# Altium schematic sheet PowerStage.SchDoc
size A4; CompanyName: HEPL; Engineer: CBR; Address1: Quai Gloesener 6; Address2: 4020, liege; SheetNumber: 4; SheetTotal: 5; Version: 1.0
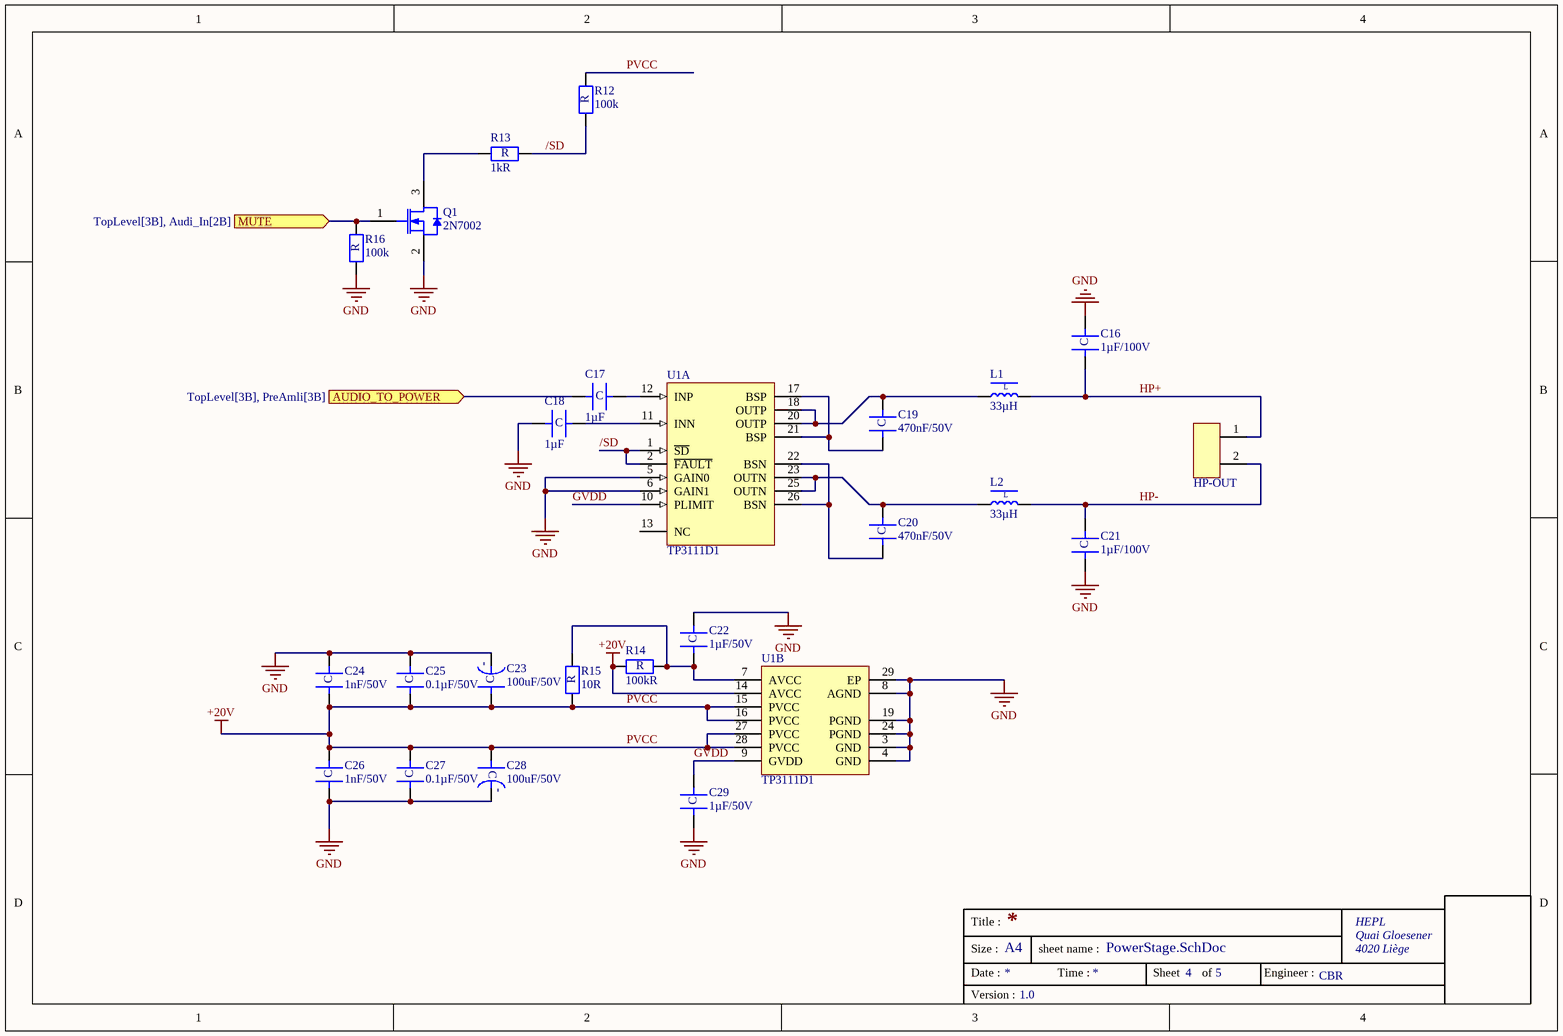
[diagram p0: PowerStage.SchDoc]

## Parts
C16  1µF/100V  [C180x75]
C17  1µF  [1206-C]
C18  1µF  [1206-C]
C19  470nF/50V  [1206-C]
C20  470nF/50V  [1206-C]
C21  1µF/100V  [C180x75]
C22  1µF/50V  [1206-C]
C23  100uF/50V  [C100x160]
C24  1nF/50V  [1206-C]
C25  0.1µF/50V  [1206-C]
C26  1nF/50V  [1206-C]
C27  0.1µF/50V  [1206-C]
C28  100uF/50V  [C100x160]
C29  1µF/50V  [1206-C]
HP-OUT  (no value)  [TS-75x70]
L1  33µH  [SRR1260]
L2  33µH  [SRR1260]
Q1  2N7002  [INF-PG-SOT23_M]
R12  100k  [1206-R]
R13  1kR  [1206-R]
R14  100kR  [1206-R]
R15  10R  [1206-R]
R16  100k  [1206-R]
U1  TP3111D1  [TI-PWP28-5720X1950TP_M]  (parts A,B of 2)

## Ports
AUDIO_TO_POWER (in, see TopLevel[3B], PreAmli[3B]), MUTE (in, see TopLevel[3B], Audi_In[2B])

## Nets
GND: C16.2 C18.1 C21.1 C22.2 C23.2 C24.2 C25.2 C26.1 C27.1 C28.2 C29.1 Q1.2(SOURCE) R16.1 U1.3(GND) U1.4(GND) U1.5(GAIN0) U1.6(GAIN1) U1.8(AGND) U1.19(PGND) U1.24(PGND) U1.29(EP)
PVCC: C23.1 C24.1 C25.1 C26.2 C27.2 C28.1 R12.2 R14.1 R15.1 U1.14(AVCC) U1.15(PVCC) U1.16(PVCC) U1.27(PVCC) U1.28(PVCC)  [also labelled +20V]
/SD: R12.1 R13.2 U1.1(~{SD}) U1.2(~{FAULT})
AUDIO_TO_POWER: C17.1 ; port AUDIO_TO_POWER
GVDD: C29.2 U1.9(GVDD) U1.10(PLIMIT)
HP+: C16.1 HP-OUT.1 L1.2(cathode)
HP-: C21.2 HP-OUT.2 L2.2(cathode)
MUTE: Q1.1(GATE) R16.2 ; port MUTE
NetC17_2: C17.2 U1.12(INP)
NetC18_2: C18.2 U1.11(INN)
NetC19_1: C19.1 U1.17(BSP) U1.21(BSP)
NetC19_2: C19.2 L1.1(Anode) U1.18(OUTP) U1.20(OUTP)
NetC20_1: C20.1 U1.22(BSN) U1.26(BSN)
NetC20_2: C20.2 L2.1(Anode) U1.23(OUTN) U1.25(OUTN)
NetC22_1: C22.1 R14.2 R15.2 U1.7(AVCC)
NetQ1_3: Q1.3(DRAIN) R13.1

Not connected (* = marked no-connect by the designer): U1 13(NC)

## Notes on the sheet
- Title :
- HEPL
- Size :
- Date :
- A4
- sheet name :
- Time :
- Sheet
- of
- Engineer :
- Quai Gloesener
- 4020 Liège
- Version :
- (in symbol Capacitor-NP) C
- (in symbol Capacitor-Pol) -; C
- (in symbol Inductor) L
- (in symbol Resistor) R

## Library data of the parts
C16 C21 = Capacitor-NP: Film Capacitor; Manufacturer: KEMET; Manufacturer Part Number: SMR15105J100B06L16.5CBULK; Supplier: Mouser; Supplier Part Number: 80-SMR15105J100B0616; Supplier Unit Price: 4.3; MOQ: 1
C17-C20 C22 C24-C27 C29 = Capacitor-NP: Manufacturer: *; Manufacturer Part Number: *; Supplier: *; Supplier Part Number: *; Supplier Unit Price: *; MOQ: *
C23 C28 = Capacitor-Pol: Manufacturer: *; Manufacturer Part Number: *; Supplier: *; Supplier Part Number: *; Supplier Unit Price: *; MOQ: *
HP-OUT = Connector-2: Fixed Terminal Blocks PT 1.5/2-3.5H 2POS HRZ 3.5mm SCREW; Manufacturer: Phoenix Contact; Manufacturer Part Number: 1984617; Supplier: Mouser; Supplier Part Number: 651-1984617; Supplier Unit Price: 0.55; MOQ: 1
L1 L2 = Inductor: Fixed Inductors 33µH 20% SMD 1260; Manufacturer: Bourns; Manufacturer Part Number: SRR1260A-330M; Supplier: Mouser; Supplier Part Number: 652-SRR1260A-330M; Supplier Unit Price: 0.791; MOQ: 1
Q1 = 2N7002HW: N-Channel Mosfet 1.75 V VGSth; Manufacturer: Diotec; Manufacturer Part Number: 2N7002; Supplier: Mouser; Supplier Part Number: 637-2N7002; Supplier Unit Price: 0.27; MOQ: 1
R12-R16 = Resistor: Manufacturer: *; Manufacturer Part Number: *; Supplier: *; Supplier Part Number: *; Supplier Unit Price: *; MOQ: *
U1 = TPA3111D1: Manufacturer: TI; Manufacturer Part Number: TPA3111D1PWP; Supplier: Mouser; Supplier Part Number: 595-TPA3111D1PWP; Supplier Unit Price: 2.4; MOQ: 1